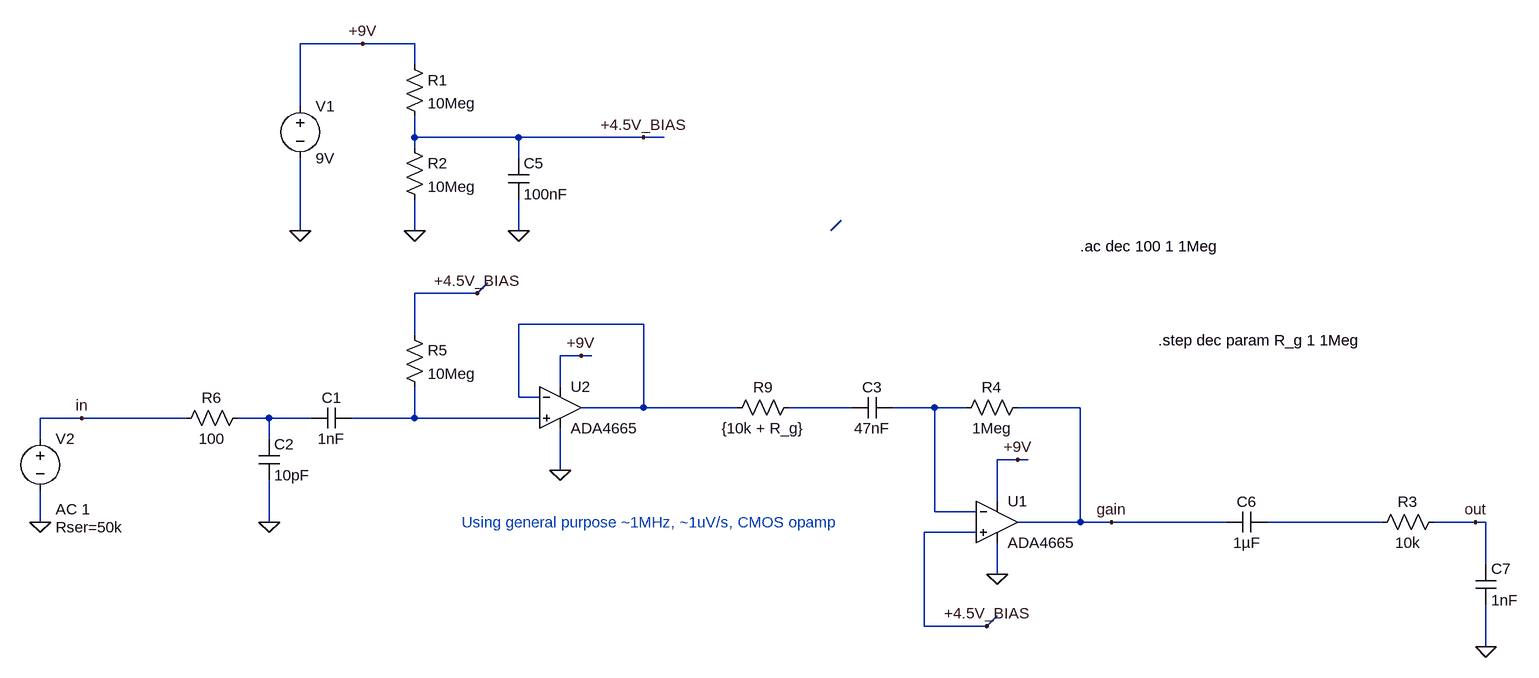
[diagram p0: schematic Distortion_Pedal_Gain_AC_Modded.asc]
Distortion_Pedal_Gain_AC_Modded.asc, the LTspice schematic file:
Version 4.1
SHEET 1 1276 680
WIRE -816 -576 -912 -576
WIRE -736 -576 -816 -576
WIRE -736 -544 -736 -576
WIRE -912 -480 -912 -576
WIRE -736 -432 -736 -464
WIRE -576 -432 -736 -432
WIRE -384 -432 -576 -432
WIRE -352 -432 -384 -432
WIRE -736 -416 -736 -432
WIRE -576 -400 -576 -432
WIRE -912 -288 -912 -400
WIRE -736 -288 -736 -336
WIRE -576 -288 -576 -336
WIRE -96 -288 -80 -304
WIRE -640 -192 -624 -208
WIRE -640 -192 -736 -192
WIRE -384 -144 -576 -144
WIRE -736 -128 -736 -192
WIRE -480 -96 -512 -96
WIRE -464 -96 -480 -96
WIRE -512 -48 -512 -96
WIRE -576 -32 -576 -144
WIRE -544 -32 -576 -32
WIRE -384 -16 -384 -144
WIRE -384 -16 -480 -16
WIRE -240 -16 -384 -16
WIRE -64 -16 -160 -16
WIRE 64 -16 0 -16
WIRE 112 -16 64 -16
WIRE 288 -16 192 -16
WIRE -1248 0 -1312 0
WIRE -1088 0 -1248 0
WIRE -960 0 -1008 0
WIRE -896 0 -960 0
WIRE -736 0 -736 -48
WIRE -736 0 -832 0
WIRE -544 0 -736 0
WIRE -1312 32 -1312 0
WIRE -960 32 -960 0
WIRE 192 64 160 64
WIRE 208 64 192 64
WIRE -512 80 -512 16
WIRE 160 128 160 64
WIRE 64 144 64 -16
WIRE 128 144 64 144
WIRE -1312 160 -1312 112
WIRE -960 160 -960 96
WIRE 288 160 288 -16
WIRE 288 160 192 160
WIRE 336 160 288 160
WIRE 512 160 336 160
WIRE 752 160 576 160
WIRE 896 160 832 160
WIRE 912 160 896 160
WIRE 128 176 48 176
WIRE 912 224 912 160
WIRE 160 240 160 192
WIRE 48 320 48 176
WIRE 144 320 160 304
WIRE 144 320 48 320
WIRE 912 352 912 288
FLAG -912 -288 0
FLAG -736 -288 0
FLAG -816 -576 +9V
FLAG -384 -432 +4.5V_BIAS
FLAG 144 320 +4.5V_BIAS
FLAG 160 240 0
FLAG -1312 160 0
FLAG 192 64 +9V
FLAG -1248 0 in
FLAG 336 160 gain
FLAG 912 352 0
FLAG -576 -288 0
FLAG 896 160 out
FLAG -960 160 0
FLAG -480 -96 +9V
FLAG -512 80 0
FLAG -640 -192 +4.5V_BIAS
SYMBOL cap -832 -16 R90
WINDOW 0 0 32 VBottom 2
WINDOW 3 32 32 VTop 2
SYMATTR InstName C1
SYMATTR Value 1nF
SYMBOL voltage -912 -496 R0
SYMATTR InstName V1
SYMATTR Value 9V
SYMBOL res -752 -560 R0
SYMATTR InstName R1
SYMATTR Value 10Meg
SYMBOL res -752 -432 R0
SYMATTR InstName R2
SYMATTR Value 10Meg
SYMBOL voltage -1312 16 R0
WINDOW 3 24 152 Left 2
WINDOW 123 24 124 Left 2
WINDOW 39 24 152 Left 2
SYMATTR Value ""
SYMATTR Value2 AC 1
SYMATTR SpiceLine Rser=50k
SYMATTR InstName V2
SYMBOL res 208 -32 R90
WINDOW 0 0 56 VBottom 2
WINDOW 3 32 56 VTop 2
SYMATTR InstName R4
SYMATTR Value 1Meg
SYMBOL res -144 -32 R90
WINDOW 0 0 56 VBottom 2
WINDOW 3 32 56 VTop 2
SYMATTR InstName R9
SYMATTR Value {10k + R_g}
SYMBOL res 736 176 R270
WINDOW 0 32 56 VTop 2
WINDOW 3 0 56 VBottom 2
SYMATTR InstName R3
SYMATTR Value 10k
SYMBOL cap -592 -400 R0
SYMATTR InstName C5
SYMATTR Value 100nF
SYMBOL cap 576 144 R90
WINDOW 0 0 32 VBottom 2
WINDOW 3 32 32 VTop 2
SYMATTR InstName C6
SYMATTR Value 1µF
SYMBOL cap 896 224 R0
SYMATTR InstName C7
SYMATTR Value 1nF
SYMBOL res -992 -16 R90
WINDOW 0 0 56 VBottom 2
WINDOW 3 32 56 VTop 2
SYMATTR InstName R6
SYMATTR Value 100
SYMBOL cap -976 32 R0
SYMATTR InstName C2
SYMATTR Value 10pF
SYMBOL res -752 -144 R0
SYMATTR InstName R5
SYMATTR Value 10Meg
SYMBOL cap 0 -32 R90
WINDOW 0 0 32 VBottom 2
WINDOW 3 32 32 VTop 2
SYMATTR InstName C3
SYMATTR Value 47nF
SYMBOL OpAmps\\ADA4665 -512 -80 R0
SYMATTR InstName U2
SYMBOL OpAmps\\ADA4665 160 96 R0
SYMATTR InstName U1
TEXT 288 -264 Left 2 !.ac dec 100 1 1Meg
TEXT 408 -120 Left 2 !.step dec param R_g 1 1Meg
TEXT -664 160 Left 2 ;Using general purpose ~1MHz, ~1uV/s, CMOS opamp

The netlist it stands for:
* Distortion_Pedal_Gain_AC_Modded.asc
C1 N006 N005 1nF
V1 +9V 0 9V
R1 +9V +4.5V_BIAS 10Meg
R2 +4.5V_BIAS 0 10Meg
V2 in 0 AC 1 Rser=50k
R4 gain N004 1Meg
R9 N003 N002 {10k + R_g}
R3 N007 out 10k
C5 +4.5V_BIAS 0 100nF
C6 N007 gain 1µF
C7 out 0 1nF
R6 N005 in 100
C2 N005 0 10pF
R5 +4.5V_BIAS N006 10Meg
C3 N004 N003 47nF
X§U2 N006 N002 +9V 0 N002 ADA4665  ; pins In+ In- V+ V- OUT
X§U1 +4.5V_BIAS N004 +9V 0 gain ADA4665  ; pins In+ In- V+ V- OUT
.ac dec 100 1 1Meg
.step dec param R_g 1 1Meg
* Using general purpose ~1MHz, ~1uV/s, CMOS opamp
.backanno
.end